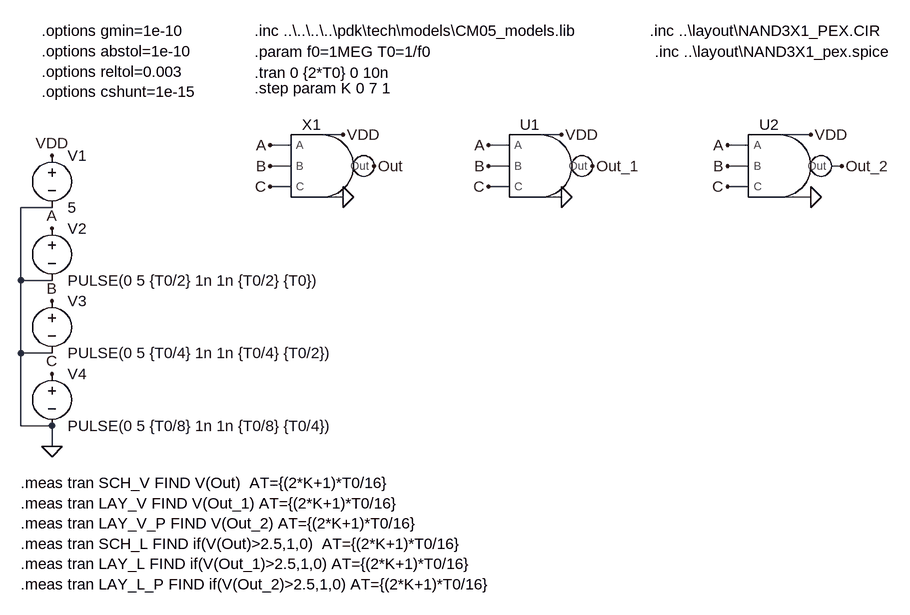
[diagram p0: schematic NAND3X1_tb.asc]
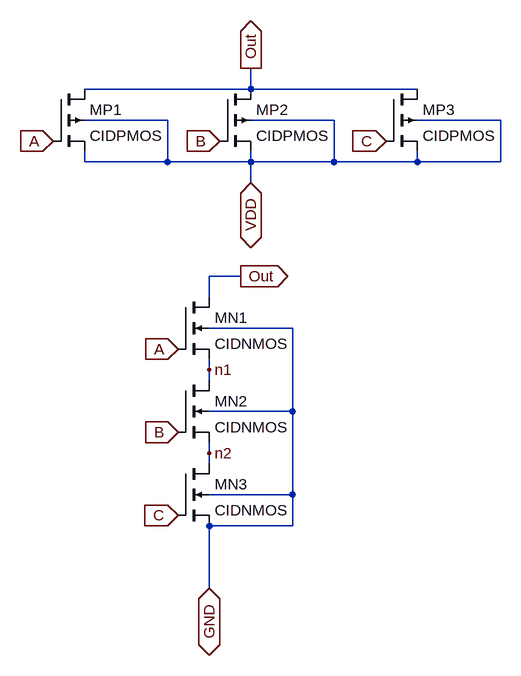
[diagram p1: sub-circuit nand3x1_sch.asc]
NAND3X1_tb.asc, the LTspice schematic file:
Version 4.1
SHEET 1 2032 772
WIRE 336 80 304 80
WIRE 672 80 640 80
WIRE 1056 80 1008 80
WIRE 256 96 224 96
WIRE 592 96 560 96
WIRE 960 96 928 96
WIRE 256 128 224 128
WIRE 592 128 560 128
WIRE 960 128 928 128
WIRE 1104 128 1088 128
WIRE 256 160 224 160
WIRE 592 160 560 160
WIRE 960 160 928 160
WIRE 336 176 304 176
WIRE 672 176 640 176
WIRE 1056 176 1008 176
WIRE -112 192 -160 192
WIRE -160 304 -160 192
WIRE -112 304 -160 304
WIRE -160 416 -160 304
WIRE -112 416 -160 416
WIRE -160 528 -160 416
WIRE -112 528 -160 528
WIRE -112 560 -112 528
FLAG 224 96 A
FLAG 224 128 B
FLAG 224 160 C
FLAG 336 80 VDD
FLAG 336 176 0
FLAG 384 128 Out
FLAG -112 448 C
FLAG -112 336 B
FLAG -112 224 A
FLAG -112 112 VDD
FLAG -112 560 0
FLAG 560 96 A
FLAG 560 128 B
FLAG 560 160 C
FLAG 720 128 Out_1
FLAG 672 80 VDD
FLAG 672 176 0
FLAG 928 96 A
FLAG 1056 176 0
FLAG 1104 128 Out_2
FLAG 928 128 B
FLAG 928 160 C
FLAG 1056 80 VDD
SYMBOL voltage -112 96 R0
SYMATTR InstName V1
SYMATTR Value 5
SYMBOL voltage -112 208 R0
SYMATTR InstName V2
SYMATTR Value PULSE(0 5 {T0/2} 1n 1n {T0/2} {T0})
SYMBOL voltage -112 320 R0
SYMATTR InstName V3
SYMATTR Value PULSE(0 5 {T0/4} 1n 1n {T0/4} {T0/2})
SYMBOL voltage -112 432 R0
SYMATTR InstName V4
SYMATTR Value PULSE(0 5 {T0/8} 1n 1n {T0/8} {T0/4})
SYMBOL NAND3X1_sch 272 128 R0
SYMATTR InstName X1
SYMBOL NAND3X1_lay_PEX 608 128 R0
SYMATTR InstName U1
SYMBOL NAND3X1_lay_PEX_magic 976 128 R0
SYMATTR InstName U2
TEXT -128 -80 Left 2 !.options gmin=1e-10\n.options abstol=1e-10\n.options reltol=0.003\n.options cshunt=1e-15
TEXT 200 -48 Left 2 !.param f0=1MEG T0=1/f0
TEXT 200 -16 Left 2 !.tran 0 {2*T0} 0 10n
TEXT 200 -80 Left 2 !.inc ..\\..\\..\\..\\pdk\\tech\\models\\CM05_models.lib
TEXT -160 616 Left 2 !.meas tran SCH_V FIND V(Out)  AT={(2*K+1)*T0/16} \n.meas tran LAY_V FIND V(Out_1) AT={(2*K+1)*T0/16} \n.meas tran LAY_V_P FIND V(Out_2) AT={(2*K+1)*T0/16}\n.meas tran SCH_L FIND if(V(Out)>2.5,1,0)  AT={(2*K+1)*T0/16} \n.meas tran LAY_L FIND if(V(Out_1)>2.5,1,0) AT={(2*K+1)*T0/16}\n.meas tran LAY_L_P FIND if(V(Out_2)>2.5,1,0) AT={(2*K+1)*T0/16}
TEXT 200 8 Left 2 !.step param K 0 7 1
TEXT 808 -80 Left 2 !.inc ..\\layout\\NAND3X1_PEX.CIR
TEXT 816 -48 Left 2 !.inc ..\\layout\\NAND3X1_pex.spice

nand3x1_sch.asc, the sub-circuit schematic file:
Version 4.1
SHEET 1 880 784
WIRE 48 -96 48 -128
WIRE 48 -96 -208 -96
WIRE 304 -96 48 -96
WIRE -80 -48 -208 -48
WIRE 176 -48 48 -48
WIRE 432 -48 304 -48
WIRE -208 16 -208 0
WIRE -80 16 -80 -48
WIRE -80 16 -208 16
WIRE 48 16 48 0
WIRE 48 16 -80 16
WIRE 176 16 176 -48
WIRE 176 16 48 16
WIRE 304 16 304 0
WIRE 304 16 176 16
WIRE 432 16 432 -48
WIRE 432 16 304 16
WIRE 48 48 48 16
WIRE 32 192 -16 192
WIRE -16 224 -16 192
WIRE 112 272 -16 272
WIRE -16 336 -16 320
WIRE -16 352 -16 336
WIRE 112 400 112 272
WIRE 112 400 -16 400
WIRE -16 464 -16 448
WIRE -16 480 -16 464
WIRE 112 528 112 400
WIRE 112 528 -16 528
WIRE 112 576 112 528
WIRE 112 576 -16 576
WIRE -16 672 -16 576
FLAG -64 304 A
IOPIN -64 304 In
FLAG -64 432 B
IOPIN -64 432 In
FLAG -64 560 C
IOPIN -64 560 In
FLAG 32 192 Out
IOPIN 32 192 Out
FLAG -16 672 GND
IOPIN -16 672 BiDir
FLAG 48 48 VDD
IOPIN 48 48 BiDir
FLAG -16 336 n1
FLAG -16 464 n2
FLAG -256 -16 A
IOPIN -256 -16 In
FLAG 0 -16 B
IOPIN 0 -16 In
FLAG 256 -16 C
IOPIN 256 -16 In
FLAG 48 -128 Out
IOPIN 48 -128 Out
SYMBOL pmos4 -256 -96 R0
SYMATTR InstName MP1
SYMATTR Value CIDPMOS
SYMATTR Value2 l=5u w=50u
SYMBOL pmos4 0 -96 R0
SYMATTR InstName MP2
SYMATTR Value CIDPMOS
SYMATTR Value2 l=5u w=50u
SYMBOL pmos4 256 -96 R0
SYMATTR InstName MP3
SYMATTR Value CIDPMOS
SYMATTR Value2 l=5u w=50u
SYMBOL nmos4 -64 224 R0
SYMATTR InstName MN1
SYMATTR Value CIDNMOS
SYMATTR Value2 l=5u w=30u
SYMBOL nmos4 -64 352 R0
SYMATTR InstName MN2
SYMATTR Value CIDNMOS
SYMATTR Value2 l=5u w=30u
SYMBOL nmos4 -64 480 R0
SYMATTR InstName MN3
SYMATTR Value CIDNMOS
SYMATTR Value2 l=5u w=30u

The netlist it stands for:
* NAND3X1_tb.asc
V1 VDD 0 5
V2 A 0 PULSE(0 5 {T0/2} 1n 1n {T0/2} {T0})
V3 B 0 PULSE(0 5 {T0/4} 1n 1n {T0/4} {T0/2})
V4 C 0 PULSE(0 5 {T0/8} 1n 1n {T0/8} {T0/4})
X§X1 A B C Out VDD 0 nand3x1_sch
X§U1 A B C Out_1 0 VDD NAND3X1  ; pins A B C Out GND VDD
X§U2 A B C VDD Out_2 0 NAND3X1_P  ; pins A B C VDD Out GND

* block symbol definitions
.subckt nand3x1_sch A B C Out VDD GND
MP1 Out A VDD VDD CIDPMOS l=5u w=50u
MP2 Out B VDD VDD CIDPMOS l=5u w=50u
MP3 Out C VDD VDD CIDPMOS l=5u w=50u
MN1 Out A n1 GND CIDNMOS l=5u w=30u
MN2 n1 B n2 GND CIDNMOS l=5u w=30u
MN3 n2 C GND GND CIDNMOS l=5u w=30u
.ends nand3x1_sch

.model NMOS NMOS
.model PMOS PMOS
.lib standard.mos
.options gmin=1e-10
.options abstol=1e-10
.options reltol=0.003
.options cshunt=1e-15
.param f0=1MEG T0=1/f0
.tran 0 {2*T0} 0 10n
.inc ..\..\..\..\pdk\tech\models\CM05_models.lib
.meas tran SCH_V FIND V(Out)  AT={(2*K+1)*T0/16}
.meas tran LAY_V FIND V(Out_1) AT={(2*K+1)*T0/16}
.meas tran LAY_V_P FIND V(Out_2) AT={(2*K+1)*T0/16}
.meas tran SCH_L FIND if(V(Out)>2.5,1,0)  AT={(2*K+1)*T0/16}
.meas tran LAY_L FIND if(V(Out_1)>2.5,1,0) AT={(2*K+1)*T0/16}
.meas tran LAY_L_P FIND if(V(Out_2)>2.5,1,0) AT={(2*K+1)*T0/16}
.step param K 0 7 1
.inc ..\layout\NAND3X1_PEX.CIR
.inc ..\layout\NAND3X1_pex.spice
.backanno
.end